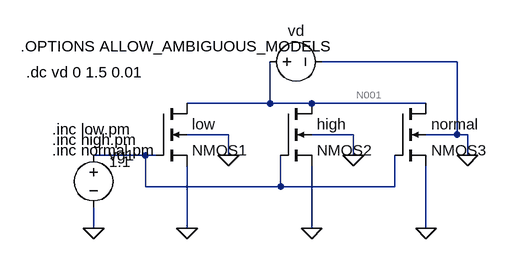
[diagram p0: schematic idvd.asc]
idvd.asc, the LTspice schematic file:
Version 4.1
SHEET 1 880 728
WIRE 560 144 352 144
WIRE 272 208 272 144
WIRE 272 208 144 208
WIRE 336 208 272 208
WIRE 512 208 336 208
WIRE 208 256 144 256
WIRE 400 256 336 256
WIRE 560 256 560 144
WIRE 560 256 512 256
WIRE 576 256 560 256
WIRE 80 288 0 288
WIRE 96 288 80 288
WIRE 208 288 208 256
WIRE 400 288 400 256
WIRE 576 288 576 256
WIRE 80 336 80 288
WIRE 288 336 288 288
WIRE 288 336 80 336
WIRE 464 336 464 288
WIRE 464 336 288 336
WIRE 0 400 0 368
WIRE 144 400 144 304
WIRE 336 400 336 304
WIRE 512 400 512 304
FLAG 0 400 0
FLAG 144 400 0
FLAG 208 288 0
FLAG 336 400 0
FLAG 400 288 0
FLAG 512 400 0
FLAG 576 288 0
SYMBOL nmos4 96 208 R0
SYMATTR InstName low
SYMATTR Value2 l=65nm w=1um
SYMATTR Value NMOS1
SYMBOL voltage 0 272 R0
WINDOW 123 0 0 Left 0
WINDOW 39 0 0 Left 0
WINDOW 3 24 26 Left 2
SYMATTR Value 1.1
SYMATTR InstName vg1
SYMBOL voltage 256 144 R270
WINDOW 0 32 56 VTop 2
WINDOW 3 22 56 VTop 2
WINDOW 123 0 0 Left 0
WINDOW 39 0 0 Left 0
SYMATTR InstName vd
SYMATTR Value ""
SYMBOL nmos4 288 208 R0
SYMATTR InstName high
SYMATTR Value2 l=65nm w=1um
SYMATTR Value NMOS2
SYMBOL nmos4 464 208 R0
SYMATTR InstName normal
SYMATTR Value2 l=65nm w=1um
SYMATTR Value NMOS3
TEXT -64 248 Left 2 !.inc low.pm
TEXT -112 120 Left 2 !.OPTIONS ALLOW_AMBIGUOUS_MODELS
TEXT -104 160 Left 2 !.dc vd 0 1.5 0.01
TEXT -64 280 Left 2 !.inc normal.pm
TEXT -64 264 Left 2 !.inc high.pm

The netlist it stands for:
* idvd.asc
M§low N001 N002 0 0 NMOS1 l=65nm w=1um
vg1 N002 0 1.1
vd N001 0
M§high N001 N002 0 0 NMOS2 l=65nm w=1um
M§normal N001 N002 0 0 NMOS3 l=65nm w=1um
.model NMOS NMOS
.model PMOS PMOS
.lib standard.mos
.inc low.pm
.OPTIONS ALLOW_AMBIGUOUS_MODELS
.dc vd 0 1.5 0.01
.inc normal.pm
.inc high.pm
.backanno
.end

* Results of the author's LTspice run, read from the files saved beside the schematic
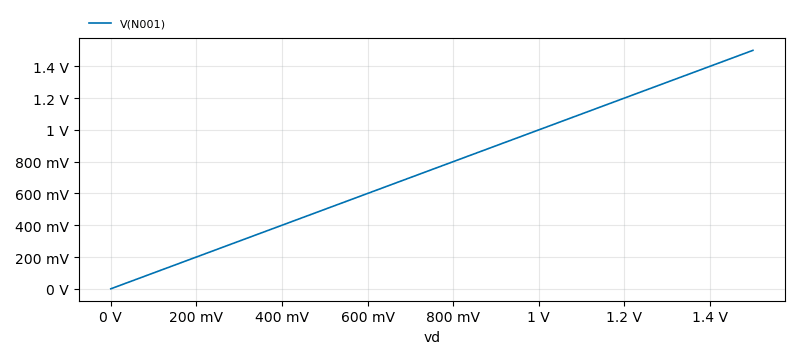
[diagram p1: DC transfer characteristic of idvd.asc, plotted from the saved traces]
* DC transfer characteristic, 1 run:
*   V(N001): 0 V at vd=0 V, 1.5 V at vd=1.5 V, min 0 V, max 1.5 V